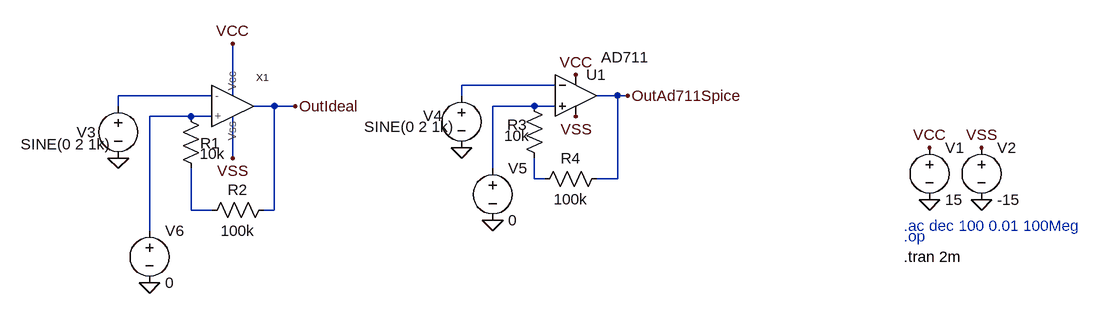
[diagram p0: schematic Comparator.asc]
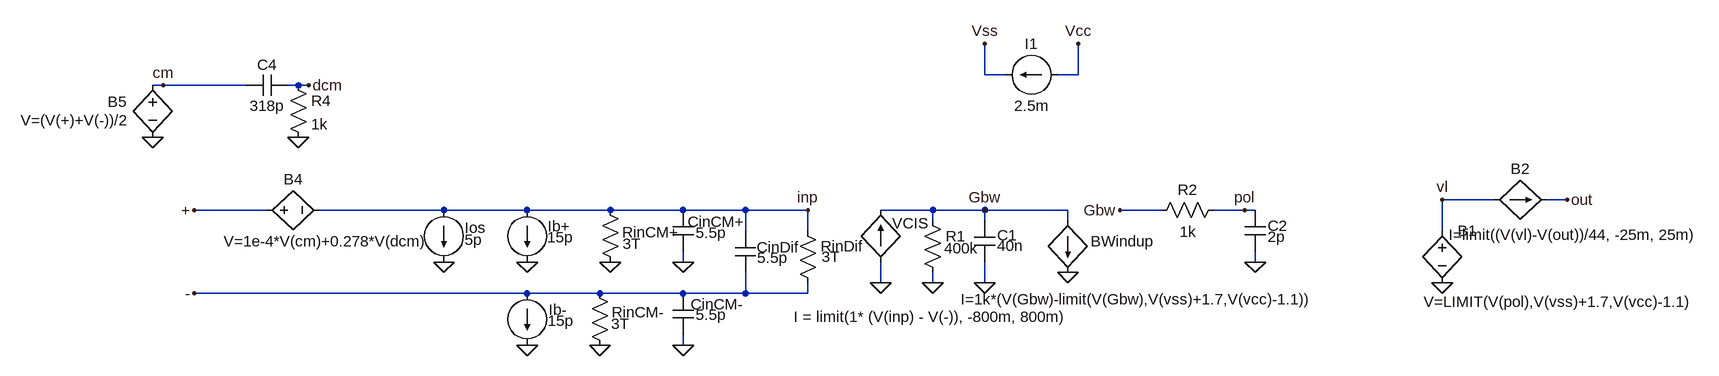
[diagram p1: sub-circuit aoideal.asc]
Comparator.asc, the LTspice schematic file:
Version 4.1
SHEET 1 912 680
WIRE 144 96 0 96
WIRE -384 112 -528 112
WIRE -352 112 -352 32
WIRE 0 112 0 96
WIRE 240 112 208 112
WIRE 256 112 240 112
WIRE -528 128 -528 112
WIRE -288 128 -320 128
WIRE -256 128 -288 128
WIRE 112 128 48 128
WIRE 144 128 112 128
WIRE -416 144 -480 144
WIRE -384 144 -416 144
WIRE -352 208 -352 144
WIRE 48 224 48 128
WIRE 112 240 112 208
WIRE 128 240 112 240
WIRE 240 240 240 112
WIRE 240 240 208 240
WIRE -416 288 -416 224
WIRE -384 288 -416 288
WIRE -288 288 -288 128
WIRE -288 288 -304 288
WIRE -480 320 -480 144
FLAG 720 272 0
FLAG 800 272 0
FLAG 720 192 VCC
FLAG 800 192 VSS
FLAG 176 80 VCC
FLAG -352 32 VCC
FLAG -352 208 VSS
FLAG 176 144 VSS
FLAG -256 128 OutIdeal
FLAG 256 112 OutAd711Spice
FLAG -528 208 0
FLAG 0 192 0
FLAG -480 400 0
FLAG 48 304 0
SYMBOL OpAmps\\AD711 176 48 R0
WINDOW 3 39 5 Left 2
SYMATTR InstName U1
SYMBOL AoIdeal -384 128 R0
SYMATTR InstName X1
SYMBOL voltage 720 176 R0
SYMATTR InstName V1
SYMATTR Value 15
SYMBOL voltage 800 176 R0
SYMATTR InstName V2
SYMATTR Value -15
SYMBOL voltage -528 112 R0
WINDOW 123 -150 75 Left 2
WINDOW 39 0 0 Left 0
WINDOW 0 -64 56 Left 2
SYMATTR Value2 SINE(0 2 1k)
SYMATTR InstName V3
SYMATTR Value ""
SYMBOL voltage 0 96 R0
WINDOW 123 -150 64 Left 2
WINDOW 39 0 0 Left 0
WINDOW 0 -59 47 Left 2
SYMATTR Value2 SINE(0 2 1k)
SYMATTR InstName V4
SYMATTR Value ""
SYMBOL res -432 128 R0
WINDOW 0 30 57 Left 2
WINDOW 3 29 73 Left 2
SYMATTR InstName R1
SYMATTR Value 10k
SYMBOL res -288 272 R90
WINDOW 0 0 56 VBottom 2
WINDOW 3 32 56 VTop 2
SYMATTR InstName R2
SYMATTR Value 100k
SYMBOL res 96 112 R0
WINDOW 0 -26 45 Left 2
WINDOW 3 -30 62 Left 2
SYMATTR InstName R3
SYMATTR Value 10k
SYMBOL res 224 224 R90
WINDOW 0 0 56 VBottom 2
WINDOW 3 32 56 VTop 2
SYMATTR InstName R4
SYMATTR Value 100k
SYMBOL voltage 48 208 R0
SYMATTR InstName V5
SYMATTR Value 0
SYMBOL voltage -480 304 R0
SYMATTR InstName V6
SYMATTR Value 0
TEXT 680 328 Left 2 ;.op
TEXT 680 312 Left 2 ;.ac dec 100 0.01 100Meg
TEXT 680 360 Left 2 !.tran 2m

aoideal.asc, the sub-circuit schematic file:
Version 4.1
SHEET 1 2688 1516
WIRE 272 -128 272 -176
WIRE 304 -128 272 -128
WIRE 416 -128 416 -176
WIRE 416 -128 384 -128
WIRE -992 -112 -1008 -112
WIRE -864 -112 -992 -112
WIRE -784 -112 -800 -112
WIRE -768 -112 -784 -112
WIRE 1056 64 976 64
WIRE 1168 64 1136 64
WIRE -832 80 -944 80
WIRE -560 80 -752 80
WIRE -432 80 -560 80
WIRE -304 80 -432 80
WIRE -192 80 -304 80
WIRE -96 80 -192 80
WIRE 0 80 -96 80
WIRE 192 80 112 80
WIRE 272 80 192 80
WIRE 400 80 272 80
WIRE 544 80 480 80
WIRE 672 80 624 80
WIRE 688 80 672 80
WIRE 192 96 192 80
WIRE 272 96 272 80
WIRE 400 96 400 80
WIRE -96 112 -96 80
WIRE 0 112 0 80
WIRE 976 112 976 64
WIRE -192 160 -192 144
WIRE 688 160 688 144
WIRE 112 192 112 160
WIRE 192 192 192 176
WIRE 272 192 272 160
WIRE -432 208 -944 208
WIRE -320 208 -432 208
WIRE -192 208 -320 208
WIRE -96 208 -96 176
WIRE -96 208 -192 208
WIRE 0 208 0 192
WIRE 0 208 -96 208
WIRE -192 288 -192 272
FLAG 112 192 0
FLAG -944 208 -
FLAG -944 80 +
FLAG 192 192 0
FLAG 272 192 0
FLAG -192 160 0
FLAG -304 160 0
FLAG -432 160 0
FLAG -560 160 0
FLAG -432 288 0
FLAG -320 288 0
FLAG -192 288 0
FLAG 0 80 inp
FLAG 272 80 Gbw
FLAG 480 80 Gbw
FLAG 688 160 0
FLAG 672 80 pol
FLAG 976 192 0
FLAG 416 -176 Vcc
FLAG 272 -176 Vss
FLAG 1168 64 out
FLAG 400 176 0
FLAG 976 64 vl
FLAG -1008 -32 0
FLAG -992 -112 cm
FLAG -768 -112 dcm
FLAG -784 -32 0
SYMBOL bi 112 160 R180
WINDOW 0 -73 60 Left 2
WINDOW 3 -289 -84 Left 2
SYMATTR InstName VCIS
SYMATTR Value I = limit(1* (V(inp) - V(-)), -800m, 800m)
SYMBOL res 176 80 R0
WINDOW 3 34 59 Left 2
SYMATTR Value 400k
SYMATTR InstName R1
SYMBOL cap 256 96 R0
WINDOW 0 35 23 Left 2
WINDOW 3 35 39 Left 2
SYMATTR InstName C1
SYMATTR Value 40n
SYMBOL current -560 80 R0
WINDOW 0 32 27 Left 2
WINDOW 3 32 46 Left 2
SYMATTR InstName Ios
SYMATTR Value 5p
SYMBOL current -432 80 R0
WINDOW 0 32 25 Left 2
WINDOW 3 31 42 Left 2
SYMATTR InstName Ib+
SYMATTR Value 15p
SYMBOL current -432 208 R0
WINDOW 0 33 25 Left 2
WINDOW 3 32 42 Left 2
SYMATTR InstName Ib-
SYMATTR Value 15p
SYMBOL res -320 64 R0
WINDOW 0 34 50 Left 2
WINDOW 3 35 68 Left 2
SYMATTR InstName RinCM+
SYMATTR Value 3T
SYMBOL res -336 192 R0
WINDOW 0 34 45 Left 2
WINDOW 3 33 63 Left 2
SYMATTR InstName RinCM-
SYMATTR Value 3T
SYMBOL cap -208 208 R0
WINDOW 0 28 17 Left 2
WINDOW 3 35 33 Left 2
SYMATTR InstName CinCM-
SYMATTR Value 5.5p
SYMBOL cap -208 80 R0
WINDOW 0 23 18 Left 2
WINDOW 3 35 35 Left 2
SYMATTR InstName CinCM+
SYMATTR Value 5.5p
SYMBOL cap -112 112 R0
WINDOW 0 33 25 Left 2
WINDOW 3 34 41 Left 2
SYMATTR InstName CinDif
SYMATTR Value 5.5p
SYMBOL res -16 96 R0
WINDOW 3 37 56 Left 2
SYMATTR Value 3T
SYMATTR InstName RinDif
SYMBOL res 640 64 R90
WINDOW 0 0 56 VBottom 2
WINDOW 3 34 55 VTop 2
SYMATTR InstName R2
SYMATTR Value 1k
SYMBOL cap 672 80 R0
WINDOW 0 35 24 Left 2
WINDOW 3 35 41 Left 2
SYMATTR InstName C2
SYMATTR Value 2p
SYMBOL bv 976 96 R0
WINDOW 3 -29 125 Left 2
SYMATTR Value V=LIMIT(V(pol),V(vss)+1.7,V(vcc)-1.1)
SYMATTR InstName B1
SYMBOL current 384 -128 R90
WINDOW 0 -32 40 VBottom 2
WINDOW 3 32 40 VTop 2
SYMATTR InstName I1
SYMATTR Value 2.5m
SYMBOL bi 400 96 R0
WINDOW 0 35 32 Left 2
WINDOW 3 -165 121 Left 2
SYMATTR InstName BWindup
SYMATTR Value I=1k*(V(Gbw)-limit(V(Gbw),V(vss)+1.7,V(vcc)-1.1))
SYMBOL bi 1056 64 R270
WINDOW 0 32 40 VTop 2
WINDOW 3 -38 122 VBottom 2
SYMATTR InstName B2
SYMATTR Value I=limit((V(vl)-V(out))/44, -25m, 25m)
SYMBOL bv -848 80 R270
WINDOW 0 32 56 VTop 2
WINDOW 3 -32 106 VBottom 2
SYMATTR InstName B4
SYMATTR Value V=1e-4*V(cm)+0.278*V(dcm)
SYMBOL bv -1008 -128 R0
WINDOW 0 -69 41 Left 2
WINDOW 3 -203 70 Left 2
SYMATTR InstName B5
SYMATTR Value V=(V(+)+V(-))/2
SYMBOL cap -864 -96 R270
WINDOW 0 32 32 VTop 2
WINDOW 3 0 32 VBottom 2
SYMATTR InstName C4
SYMATTR Value 318p
SYMBOL res -800 -128 R0
SYMATTR InstName R4
SYMATTR Value 1k

The netlist it stands for:
* Comparator.asc
X§U1 N003 N001 VCC VSS OutAd711Spice AD712  ; pins In+ In- V+ V- OUT
X§X1 N002 N004 OutIdeal VCC VSS aoideal
V1 VCC 0 15
V2 VSS 0 -15
V3 N002 0 SINE(0 2 1k)
V4 N001 0 SINE(0 2 1k)
R1 N004 N006 10k
R2 OutIdeal N006 100k
R3 N003 N005 10k
R4 OutAd711Spice N005 100k
V5 N003 0 0
V6 N004 0 0

* block symbol definitions
.subckt aoideal - + Out Vcc Vss
B§VCIS 0 Gbw I = limit(1* (V(inp) - V(-)), -800m, 800m)
R1 Gbw 0 400k
C1 Gbw 0 40n
Ios inp 0 5p
Ib+ inp 0 15p
Ib- - 0 15p
RinCM+ inp 0 3T
RinCM- - 0 3T
CinCM- - 0 5.5p
CinCM+ inp 0 5.5p
CinDif inp - 5.5p
RinDif inp - 3T
R2 pol Gbw 1k
C2 pol 0 2p
B1 vl 0 V=LIMIT(V(pol),V(vss)+1.7,V(vcc)-1.1)
I1 Vcc Vss 2.5m
BWindup Gbw 0 I=1k*(V(Gbw)-limit(V(Gbw),V(vss)+1.7,V(vcc)-1.1))
B2 vl out I=limit((V(vl)-V(out))/44, -25m, 25m)
B4 + inp V=1e-4*V(cm)+0.278*V(dcm)
B5 cm 0 V=(V(+)+V(-))/2
C4 cm dcm 318p
R4 dcm 0 1k
.ends aoideal

* .op
* .ac dec 100 0.01 100Meg
.tran 2m
.lib ADI1.lib
.backanno
.end